# Altium project Electrode_Board.PrjPcb
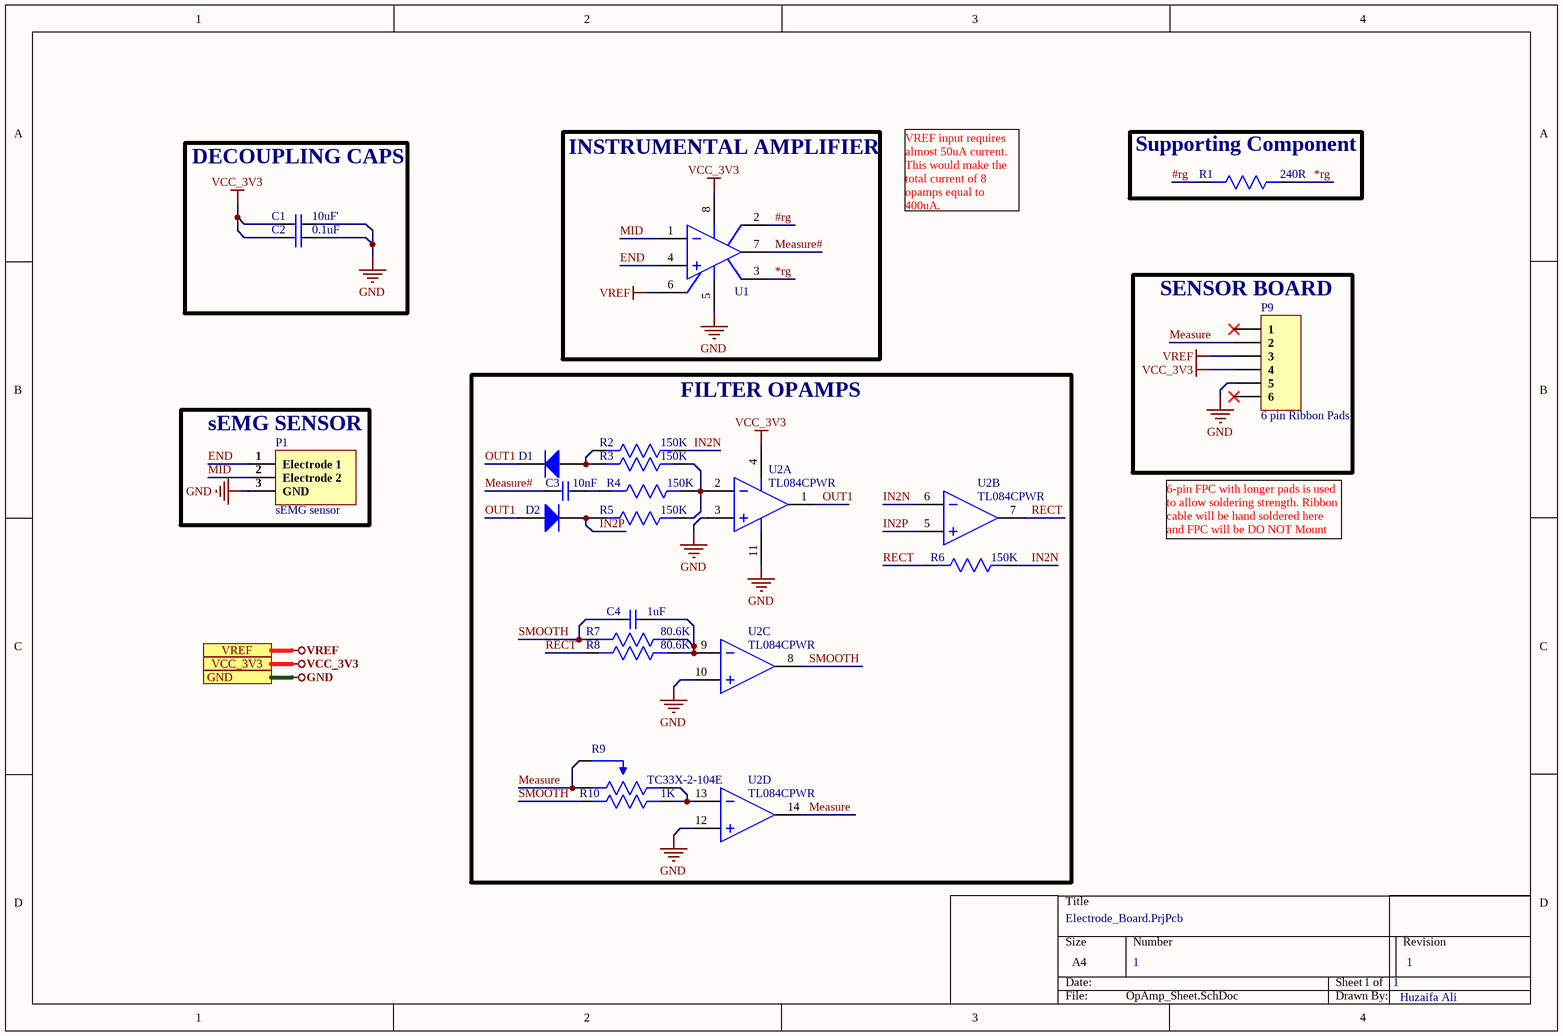
[diagram p0: OpAmp_Sheet.SchDoc]
1 sheet, 20 parts. Net scope: flat (ports and power ports of the same name join across sheets).
Board file: Electrode_PCB.PcbDoc

## Sheet OpAmp_Sheet.SchDoc: =Projectname
size A4; SheetNumber: 1; SheetTotal: 1

### Parts
C1  10uF'  [Cap0603]
C2  0.1uF  [Cap 0402]
C3  10nF  [Cap 0402]
C4  1uF  [Cap 0402]
D1  1N4148WS  [SOD-323]  (value not drawn)
D2  1N4148WS  [SOD-323]  (value not drawn)
P1  sEMG sensor  [sEMG sensor]
P9  6 pin Ribbon Pads  [6 pin Ribbon Pads.]
R1  240R  [Res0402]
R2  150K  [Res0402]
R3  150K  [Res0402]
R4  150K  [Res0402]
R5  150K  [Res0402]
R6  150K  [Res0402]
R7  80.6K  [Res0402]
R8  80.6K  [Res0402]
R9  TC33X-2-104E  [TC33X-2-104E]
R10  1K  [Res0402]
U1  AD8221ARZ-R7  [SOIC-8]  (value not drawn)
U2  TL084CPWR  [14TSSOP]  (parts A,B,C,D of 4)

### Blocks framed on the sheet
INSTRUMENTAL AMPLIFIER: U1
Supporting Component: R1
DECOUPLING CAPS: C1 C2
SENSOR BOARD: P9
sEMG SENSOR: P1
FILTER OPAMPS: C3 C4 D1 D2 R2-R10 U2

### Ports
GND, VCC_3V3, VREF

### Nets
GND: C1.2 C2.2 P1.3(GND) P9.5 U1.5(V-) U2.3(IN+) U2.10(3IN+) U2.11(VCC-) U2.12(4IN+) ; port GND
VCC_3V3: C1.1 C2.1 P9.4 U1.8(V+) U2.4(VCC+) ; port VCC_3V3
VREF: P9.3 U1.6(REF) ; port VREF
#rg: R1.2 U1.2(RG)
*rg: R1.1 U1.3(RG)
END: P1.1(Electrode_1) U1.4(IN+)
IN2N: R2.1 R6.1 U2.6(2IN-)
IN2P: D2.1(K) R5.2 U2.5(2IN+)
Measure: P9.2 R9.1(CCW) R9.2(Wiper) U2.14(4OUT)
Measure#: C3.1 U1.7(VOUT)
MID: P1.2(Electrode_2) U1.1(IN-)
OUT1: D1.1(K) D2.2(A) U2.1(1OUT)
RECT: R6.2 R8.2 U2.7(2OUT)
SMOOTH: C4.1 R7.2 R10.2 U2.8(3OUT)
NetC3_2: C3.2 R4.2
NetC4_2: C4.2 R7.1 R8.1 U2.9(3IN-)
NetD1_2: D1.2(A) R2.2 R3.2
NetR3_1: R3.1 R4.1 R5.1 U2.2(IN-)
NetR9_3: R9.3(CW) R10.1 U2.13(4IN-)

Not connected (* = marked no-connect by the designer): P9 1* 6*

### Notes on the sheet
- VREF input requires almost 50uA current. This would make the total current of 8 opamps equal to 400uA.
- 6-pin FPC with longer pads is used to allow soldering strength. Ribbon cable will be hand soldered here and FPC will be DO NOT Mount
- 1
- Huzaifa Ali

### Library data of the parts
C1 = CL10A106MA8NRNC: CAP CER 10UF 25V X5R 0603; Manufacturer: Samsung; Tolerance: 20%; Supplier 1: Avnet; Manufacturer Part Number: CL10A106MA8NRNC; RoHS: Yes; Category: Ceramic Capacitors; Pricing 1: 4000=0.03753, 8000=0.03700, 16000=0.03595, 24000=0.03515, 32000=0.03383, 40000=0.03304, 400000=0.03225 (USD); Mount: Surface Mount; Case/Package: 0603; Case Code (Metric): 1608; Case Code (Imperial): 0603; Contact Plating: Tin; Min Operating Temperature: -55°C; Max Operating Temperature: 85°C; Package Quantity: 1; Packaging: Tape and Reel; Capacitance: 10uF; Voltage Rating: 25V; Dielectric: X5R; Termination: Wraparound; Series: CL; Construction: Flat; Length: 0.063inch; Width: 0.031inch; Thickness: 0.035inch; Lead Free: Lead Free; RoHS Compliant: Yes; ComponentLink1URL: https://datasheet.ciiva.com/25766/cl10a106ma8nrnc-25766562.pdf?src-supplier=Digi-Key; ComponentLink1Description: https://datasheet.ciiva.com/25766/cl10a106ma8nrnc-25766562.pdf?src-supplier=Digi-Key; Supplier Part Number 1: CL10A106MA8NRNC
C2 = GRM155R71H104ME14D: CAP CER 0.1UF 50V X7R 0402; Manufacturer: Murata; Tolerance: 20%; Capacitance: 100nF; Supplier 1: Digi-Key; Manufacturer Part Number: GRM155R71H104ME14D; Stock 1: 439844; Pricing 1: 1=0.1, 10=0.038, 100=0.0168, 500=0.01198, 1000=0.00941, 2500=0.00855, 5000=0.00787 (USD); Mount: Surface Mount; Case/Package: 0402; Min Operating Temperature: -55°C; Max Operating Temperature: 125°C; Packaging: Cut Tape; Voltage Rating: 50V; Length: 0.039inch; Width: 0.02inch; Thickness: 0.022inch; ComponentLink1URL: http://search.murata.co.jp/Ceramy/image/img/A01X/G101/ENG/GRM155R71H104ME14-01.pdf?src-supplier=Digi-Key; ComponentLink1Description: http://search.murata.co.jp/Ceramy/image/img/A01X/G101/ENG/GRM155R71H104ME14-01.pdf?src-supplier=Digi-Key; ComponentLink2URL: http://psearch.en.murata.com/capacitor/product/GRM155R71H104ME14%23.pdf?src-supplier=Avnet; ComponentLink2Description: http://psearch.en.murata.com/capacitor/product/GRM155R71H104ME14%23.pdf?src-supplier=Avnet; ComponentLink3URL: http://components.arrow.com/part/dataview/0323_07177683?src-supplier=Arrow+Europe; ComponentLink3Description: http://components.arrow.com/part/dataview/0323_07177683?src-supplier=Arrow+Europe; ComponentLink4URL: http://www.mouser.com/ds/2/281/c02e-2905.pdf?src-supplier=Mouser; ComponentLink4Description: http://www.mouser.com/ds/2/281/c02e-2905.pdf?src-supplier=Mouser; Supplier Part Number 1: 490-10701-1-ND
C3 = CC0402KRX7R9BB103: CAP CER 10nF 50V 0402 SMD; Supplier 1: Arrow Electronics; Supplier Part Number 1: CC0402KRX7R9BB103
C4 = CC0402KRX5R7BB105: CAP CER 1UF 16V X5R 0402; Manufacturer: Yageo; Tolerance: 10%; Supplier 1: Digi-Key; Manufacturer Part Number: CC0402KRX5R7BB105; Stock 1: 1405667; Pricing 1: 1=0.36, 10=0.252, 100=0.1512, 500=0.1134, 1000=0.09576, 2500=0.09072, 5000=0.08568 (USD); Mount: Surface Mount; Case/Package: 0402; Weight: 2.3E-05oz; Case Code (Imperial): 0402; Case Code (Metric): 1005; Min Operating Temperature: -55°C; Max Operating Temperature: 85°C; Capacitance: 1uF; Dielectric: X5R; Packaging: Tape and Reel; Voltage Rating (DC): 16V; Voltage Rating: 16V; Termination: SMD/SMT; Composition: Ceramic; Length: 1mm; Height: 0.5mm; Width: 0.02inch; Thickness: 0.022inch; Depth: 0.5mm; Radiation Hardening: No; Lead Free: Lead Free; Halogen Free: Halogen Free; ComponentLink1URL: http://www.yageo.com/documents/recent/UPY-GPHC_X5R_4V-to-50V_12.pdf?src-supplier=Avnet+Europe; ComponentLink1Description: http://www.yageo.com/documents/recent/UPY-GPHC_X5R_4V-to-50V_12.pdf?src-supplier=Avnet+Europe; Supplier Part Number 1: 311-1691-6-ND
D1 D2 = 1N4148WS: 100V -55℃~+150℃@(Tj) 400mW Single 1.25V@150mA 4ns 1μA@75V 200mA SOD-323 Switching Diode ROHS; Manufacturer: YFW; ComponentLink1Description: LCSC; ComponentLink1URL: https://lcsc.com/product-detail/Switching-Diode_YFW-1N4148WS_C1884546.html; Manufacturer Part Number: 1N4148WS
P1 = sEMG sensor: Sensor Connecting Pads
P9 = 6 pin Ribbon Pads: Ribbon wire Connection Pads
R1 = RC0402FR-07240RL: RES SMD 0402 240 Ohm 1% 1/16W ±100ppm/°C Molded SMD Paper T/R; Manufacturer: Yageo; Power Rating: 63mW; Voltage Rating (DC): 50V; Supplier 1: Arrow Electronics; Manufacturer Part Number: RC0402FR-07240RL; RoHS: Yes; Category: Chip SMD Resistors; Stock 1: 3138480; Pricing 1: 10000=0.00190 (USD); Case/Package: 0402; Case Code (Metric): 1005; Case Code (Imperial): 0402; Size Code: 0402; Min Operating Temperature: -55°C; Max Operating Temperature: 155°C; Resistance: 240R; Tolerance: 1%; Packaging: Tape and Reel; Resistor Type: Thick Film; Temperature Coefficient: 100ppm/°C; Voltage Rating: 50V; Package Quantity: 1; Number of Terminations: 2; Termination: SMD/SMT; Max Power Dissipation: 63mW; Features: Moisture Resistant; Series: RC; Construction: Rectangular; Resistance Tolerance: 1%; Length: 1mm; Width: 0.02inch; Height: 0.016inch; Depth: 0.5mm; REACH SVHC: Unknown; Lead Free: Lead Free; RoHS Compliant: Yes; Military Standard: Not; ComponentLink1URL: https://datasheet.ciiva.com/7849/1018594-7849915.pdf?src-supplier=Element14; ComponentLink1Description: https://datasheet.ciiva.com/7849/1018594-7849915.pdf?src-supplier=Element14; ComponentLink2URL: https://datasheet.ciiva.com/7849/1018594-7849916.pdf?src-supplier=Element14; ComponentLink2Description: https://datasheet.ciiva.com/7849/1018594-7849916.pdf?src-supplier=Element14; ComponentLink3URL: https://datasheet.ciiva.com/2519/pyu-r-int-thick-7-2519157.pdf?src-supplier=Digi-Key; ComponentLink3Description: https://datasheet.ciiva.com/2519/pyu-r-int-thick-7-2519157.pdf?src-supplier=Digi-Key; ComponentLink4URL: https://datasheet.ciiva.com/2519/pyu-r-int-thick-7-2519158.pdf?src-supplier=Digi-Key; ComponentLink4Description: https://datasheet.ciiva.com/2519/pyu-r-int-thick-7-2519158.pdf?src-supplier=Digi-Key; ComponentLink5URL: https://datasheet.ciiva.com/2519/pyu-r-int-thick-7-2519156.pdf?src-supplier=Digi-Key; ComponentLink5Description: https://datasheet.ciiva.com/2519/pyu-r-int-thick-7-2519156.pdf?src-supplier=Digi-Key; ComponentLink6URL: https://datasheet.ciiva.com/12669/pyu-rc0402-51-rohs-l-6-r-12669689.pdf?src-supplier=Mouser; ComponentLink6Description: https://datasheet.ciiva.com/12669/pyu-rc0402-51-rohs-l-6-r-12669689.pdf?src-supplier=Mouser; ComponentLink7URL: https://datasheet.ciiva.com/17419/pyu-rc0402-51-rohs-l-6-r-17419482.pdf?src-supplier=Future+Electronics; ComponentLink7Description: https://datasheet.ciiva.com/17419/pyu-rc0402-51-rohs-l-6-r-17419482.pdf?src-supplier=Future+Electronics; Supplier Part Number 1: RC0402FR-07240RL
R2-R6 = RC0402JR-07150KL: RES SMD 0402 150kOhm 5% Paper T/R; Manufacturer: Yageo; Resistance: 150kR; Power Rating: 63mW; Voltage Rating: 50V; Temperature Coefficient: 100ppm/°C; Supplier 1: Arrow Electronics; Manufacturer Part Number: RC0402JR-07150KL; RoHS: Yes; Category: Chip SMD Resistors; Stock 1: 170000; Pricing 1: 10000=0.00100 (USD); Case/Package: 0402; Case Code (Metric): 1005; Case Code (Imperial): 0402; Weight: 2.3E-05oz; Size Code: 0402; Min Operating Temperature: -55°C; Max Operating Temperature: 155°C; Package Quantity: 1; Tolerance: 5%; Packaging: Tape and Reel; Resistor Type: Thick Film; Number of Terminations: 2; Termination: SMD/SMT; Max Power Dissipation: 63mW; Features: Moisture Resistant; Series: RC; Construction: Rectangular; Resistance Tolerance: 5%; Length: 1mm; Width: 0.02inch; Height: 0.016inch; Depth: 0.5mm; REACH SVHC: No SVHC; Military Standard: Not; Lead Free: Lead Free; RoHS Compliant: Yes; ComponentLink1URL: https://datasheet.ciiva.com/7983/1018594-7983551.pdf?src-supplier=Element14; ComponentLink1Description: https://datasheet.ciiva.com/7983/1018594-7983551.pdf?src-supplier=Element14; ComponentLink2URL: https://datasheet.ciiva.com/2518/pyu-r-int-thick-7-2518929.pdf?src-supplier=Digi-Key; ComponentLink2Description: https://datasheet.ciiva.com/2518/pyu-r-int-thick-7-2518929.pdf?src-supplier=Digi-Key; ComponentLink3URL: https://datasheet.ciiva.com/2518/pyu-r-int-thick-7-2518930.pdf?src-supplier=Digi-Key; ComponentLink3Description: https://datasheet.ciiva.com/2518/pyu-r-int-thick-7-2518930.pdf?src-supplier=Digi-Key; ComponentLink4URL: https://datasheet.ciiva.com/2518/pyu-r-int-thick-7-2518928.pdf?src-supplier=Digi-Key; ComponentLink4Description: https://datasheet.ciiva.com/2518/pyu-r-int-thick-7-2518928.pdf?src-supplier=Digi-Key; ComponentLink5URL: https://datasheet.ciiva.com/7850/1018594-7850149.pdf?src-supplier=Element14; ComponentLink5Description: https://datasheet.ciiva.com/7850/1018594-7850149.pdf?src-supplier=Element14; ComponentLink6URL: https://datasheet.ciiva.com/17072/pyu-rc0402-51-rohs-l-6-r-17072379.pdf?src-supplier=Future+Electronics; ComponentLink6Description: https://datasheet.ciiva.com/17072/pyu-rc0402-51-rohs-l-6-r-17072379.pdf?src-supplier=Future+Electronics; ComponentLink7URL: https://datasheet.ciiva.com/15189/getdatasheetpartid-251830-15189543.pdf?src-supplier=Verical; ComponentLink7Description: https://datasheet.ciiva.com/15189/getdatasheetpartid-251830-15189543.pdf?src-supplier=Verical; Supplier Part Number 1: RC0402JR-07150KL
R7 R8 = RC-02W8062FT: 1/16W 50V ±1% ±200ppm/℃ -55℃~+155℃ 80.6kΩ 0402 Chip Resistor - Surface Mount ROHS; Manufacturer: FH; Manufacture Part Number: RC-02W8062FT; Footprint: 0402; Value: 80.6K
R9 = TC33X-2-104E: TRIMMER 100K OHM 0.1W J LEAD TOP; Manufacturer: Bourns; Resistance: 100kR; Tolerance: 25%; Power Rating: 100mW; Number of Turns: 1; Temperature Coefficient: 250ppm/°C; Voltage Rating (DC): 50V; Supplier 1: Arrow Electronics; Manufacturer Part Number: TC33X-2-104E; RoHS: Yes; Category: Variable Resistors and Potentiometers; Stock 1: 12500; Pricing 1: 2500=0.15500, 5000=0.13130 (USD); Mount: Surface Mount; Color: Silver; Weight: 29.4mg; Min Operating Temperature: -40°C; Max Operating Temperature: 100°C; Packaging: Tape and Reel; Package Quantity: 2500; Resistor Type: Carbon,Cermet; Termination: Foot Print; Max Power Dissipation: 100mW; Series: TC33; Resistance Tolerance: 25%; Length: 3mm; Width: 0.118inch; Height: 0.047inch; Depth: 3.8mm; Radiation Hardening: No; REACH SVHC: No SVHC; Military Standard: Not; RoHS Compliant: Yes; ComponentLink1URL: https://datasheet.ciiva.com/11832/0900766b802749b3-11832506.pdf?src-supplier=RSComponents; ComponentLink1Description: https://datasheet.ciiva.com/11832/0900766b802749b3-11832506.pdf?src-supplier=RSComponents; ComponentLink2URL: https://datasheet.ciiva.com/8700/tc33-8700395.pdf?src-supplier=Avnet; ComponentLink2Description: https://datasheet.ciiva.com/8700/tc33-8700395.pdf?src-supplier=Avnet; ComponentLink3URL: https://datasheet.ciiva.com/2155/tc33-2155965.pdf?src-supplier=Digi-Key; ComponentLink3Description: https://datasheet.ciiva.com/2155/tc33-2155965.pdf?src-supplier=Digi-Key; ComponentLink4URL: https://datasheet.ciiva.com/7953/1818686-7953181.pdf?src-supplier=Element14; ComponentLink4Description: https://datasheet.ciiva.com/7953/1818686-7953181.pdf?src-supplier=Element14; ComponentLink5URL: https://datasheet.ciiva.com/16716/70155234-16716301.pdf?src-supplier=Allied+Electronics; ComponentLink5Description: https://datasheet.ciiva.com/16716/70155234-16716301.pdf?src-supplier=Allied+Electronics; ComponentLink6URL: https://datasheet.ciiva.com/2155/tc33-2155966.pdf?src-supplier=Digi-Key; ComponentLink6Description: https://datasheet.ciiva.com/2155/tc33-2155966.pdf?src-supplier=Digi-Key; ComponentLink7URL: https://datasheet.ciiva.com/7953/1818686-7953182.pdf?src-supplier=Element14; ComponentLink7Description: https://datasheet.ciiva.com/7953/1818686-7953182.pdf?src-supplier=Element14; ComponentLink8URL: https://datasheet.ciiva.com/2155/tc33-2155967.pdf?src-supplier=Digi-Key; ComponentLink8Description: https://datasheet.ciiva.com/2155/tc33-2155967.pdf?src-supplier=Digi-Key; Supplier Part Number 1: TC33X-2-104E
R10 = RC0402JR-071KL: RES 1K OHM 5% 1/16W 0402; Manufacturer: Yageo; Resistance: 1kR; Power Rating: 62.5mW; Voltage Rating: 50V; Temperature Coefficient: 100ppm/°C; Max Power Dissipation: 63mW; Supplier 1: Digi-Key; Manufacturer Part Number: RC0402JR-071KL; RoHS: Yes; Category: Chip SMD Resistors; Stock 1: 452315; Pricing 1: 1=0.10000, 10=0.01300, 100=0.00540, 1000=0.00244, 2500=0.00212, 5000=0.00175 (USD); Case/Package: 0402; Case Code (Imperial): 0402; Case Code (Metric): 1005; Size Code: 0402; Min Operating Temperature: -55°C; Max Operating Temperature: 155°C; Tolerance: 5%; Packaging: Tape and Reel; Package Quantity: 1; Termination: SMD/SMT; Resistor Type: Thick Film; Number of Terminations: 2; Features: Moisture Resistant; Series: RC; Resistance Tolerance: 5%; Construction: Rectangular; Length: 0.039inch; Width: 0.02inch; Height: 0.016inch; Depth: 0.5mm; REACH SVHC: No SVHC; Military Standard: Not; Lead Free: Lead Free; RoHS Compliant: Yes; ComponentLink1URL: https://datasheet.ciiva.com/7983/1018594-7983558.pdf?src-supplier=Element14; ComponentLink1Description: https://datasheet.ciiva.com/7983/1018594-7983558.pdf?src-supplier=Element14; ComponentLink2URL: https://datasheet.ciiva.com/2452/pyu-r-int-thick-7-2452756.pdf?src-supplier=Digi-Key; ComponentLink2Description: https://datasheet.ciiva.com/2452/pyu-r-int-thick-7-2452756.pdf?src-supplier=Digi-Key; ComponentLink3URL: https://datasheet.ciiva.com/2452/pyu-r-int-thick-7-2452757.pdf?src-supplier=Digi-Key; ComponentLink3Description: https://datasheet.ciiva.com/2452/pyu-r-int-thick-7-2452757.pdf?src-supplier=Digi-Key; ComponentLink4URL: https://datasheet.ciiva.com/2452/pyu-r-int-thick-7-2452755.pdf?src-supplier=Digi-Key; ComponentLink4Description: https://datasheet.ciiva.com/2452/pyu-r-int-thick-7-2452755.pdf?src-supplier=Digi-Key; ComponentLink5URL: https://datasheet.ciiva.com/7850/1018594-7850170.pdf?src-supplier=Element14; ComponentLink5Description: https://datasheet.ciiva.com/7850/1018594-7850170.pdf?src-supplier=Element14; ComponentLink6URL: https://datasheet.ciiva.com/7850/1018594-7850171.pdf?src-supplier=Element14; ComponentLink6Description: https://datasheet.ciiva.com/7850/1018594-7850171.pdf?src-supplier=Element14; ComponentLink7URL: https://datasheet.ciiva.com/17081/pyu-rc0402-51-rohs-l-6-r-17081438.pdf?src-supplier=Future+Electronics; ComponentLink7Description: https://datasheet.ciiva.com/17081/pyu-rc0402-51-rohs-l-6-r-17081438.pdf?src-supplier=Future+Electronics; Supplier Part Number 1: 311-1.0KJRCT-ND
U1 = AD8221ARZ-R7: IC OPAMP INSTR 825KHZ 8SOIC; Manufacturer: Analog Devices; Number of Channels: 1; Common Mode Rejection Ratio: 80dB; Min Dual Supply Voltage: 2.3V; Max Dual Supply Voltage: 18V; Slew Rate: 2.5V/µs; Nominal Supply Current: 1mA; Max Power Dissipation: 200mW; Bandwidth: 562kHz; Input Bias Current: 1.5nA; Input Offset Voltage (Vos): 60uV; Output Current per Channel: 18mA; Power Supply Rejection Ratio (PSRR): 130dB; Voltage Gain: 60dB; Input Resistance: 100GR; Quiescent Current: 900uA; Operating Supply Voltage: 36V; Supplier 1: Mouser; Manufacturer Part Number: AD8221ARZ-R7; RoHS: Yes; Category: Amplifiers - Op Amps, Buffer, Instrumentation; Pricing 1: 1=7.37000, 10=6.66000, 25=6.35000, 50=6.35000, 100=5.51000, 250=5.27000, 500=4.80000, 1000=4.37000, 10000=4.37000 (USD); Case/Package: SOIC; Number of Pins: 8; Contact Plating: Tin,Matte; Min Operating Temperature: -40°C; Max Operating Temperature: 85°C; -3db Bandwidth: 825kHz; Package Quantity: 1000; Packaging: Tape and Reel; Number of Circuits: 1; Operating Supply Current: 1mA; Number of Elements: 1; Power Dissipation: 200mW; Series: -; Supply Current: 1mA; Radiation Hardening: No; Lead Free: Contains Lead; RoHS Compliant: Yes; ComponentLink1URL: https://datasheet.ciiva.com/15128/getdatasheetpartid-313520-15128733.pdf?src-supplier=Verical; ComponentLink1Description: https://datasheet.ciiva.com/15128/getdatasheetpartid-313520-15128733.pdf?src-supplier=Verical; ComponentLink2URL: https://datasheet.ciiva.com/2975/ad8221-2975658.pdf?src-supplier=Avnet; ComponentLink2Description: https://datasheet.ciiva.com/2975/ad8221-2975658.pdf?src-supplier=Avnet; ComponentLink3URL: https://datasheet.ciiva.com/2975/ad8221-2975980.pdf?src-supplier=Avnet; ComponentLink3Description: https://datasheet.ciiva.com/2975/ad8221-2975980.pdf?src-supplier=Avnet; ComponentLink4URL: https://datasheet.ciiva.com/6628/ad8221-6628618.pdf?src-supplier=Digi-Key; ComponentLink4Description: https://datasheet.ciiva.com/6628/ad8221-6628618.pdf?src-supplier=Digi-Key; ComponentLink5URL: https://datasheet.ciiva.com/6628/ad8221-6628619.pdf?src-supplier=Digi-Key; ComponentLink5Description: https://datasheet.ciiva.com/6628/ad8221-6628619.pdf?src-supplier=Digi-Key; ComponentLink6URL: https://datasheet.ciiva.com/6628/ad8221-6628617.pdf?src-supplier=Digi-Key; ComponentLink6Description: https://datasheet.ciiva.com/6628/ad8221-6628617.pdf?src-supplier=Digi-Key; ComponentLink7URL: https://datasheet.ciiva.com/48709/001249009-da-01-en-ic-amp-inst-prec-ad8221arz-r7-soic-8-adi-48709526.pdf?src-supplier=Conrad; ComponentLink7Description: https://datasheet.ciiva.com/48709/001249009-da-01-en-ic-amp-inst-prec-ad8221arz-r7-soic-8-adi-48709526.pdf?src-supplier=Conrad; Supplier Part Number 1: 584-AD8221ARZ-R7
U2 = TL084CPWR: IC OPAMP JFET 4 CIRCUIT 14TSSOP; Manufacturer: Texas Instruments; Nominal Supply Current: 11.2mA; Number of Channels: 4; Voltage Gain: 106.02dB; Max Dual Supply Voltage: 18V; Min Dual Supply Voltage: 3.5V; Unity Gain Bandwidth Product: 3MHz; Common Mode Rejection Ratio: 70dB; Slew Rate: 13V/µs; Max I/O Voltage: 15mV; Input Bias Current: 400pA; Operating Supply Current: 1.4mA; Min Supply Voltage: 7V; Quiescent Current: 2.8A; Max Power Dissipation: 680mW; Supplier 1: Mouser; Manufacturer Part Number: TL084CPWR; RoHS: Yes; Category: Amplifiers - Op Amps, Buffer, Instrumentation; Stock 1: 3; Pricing 1: 1=0.64000, 10=0.54500, 50=0.54500, 100=0.37800, 500=0.32000, 1000=0.24700, 2000=0.22500, 10000=0.22500 (USD); Case/Package: TSSOP; Number of Pins: 14; Contact Plating: Gold; Min Operating Temperature: -40°C; Max Operating Temperature: 125°C; Packaging: Tape and Reel; Package Quantity: 1; Bandwidth: 3MHz; Nominal Gain Bandwidth Product: 3MHz; Number of Circuits: 4; Gain Bandwidth Product: 3MHz; Input Offset Voltage (Vos): 15mV; Number of Elements: 4; Max Supply Voltage: 18V; Number of Amplifiers: 4; Radiation Hardening: No; Lead Free: Lead Free; RoHS Compliant: Yes; REACH SVHC: No SVHC; ComponentLink1URL: https://datasheet.ciiva.com/34301/1064719-34301936.pdf?src-supplier=Jameco; ComponentLink1Description: https://datasheet.ciiva.com/34301/1064719-34301936.pdf?src-supplier=Jameco; ComponentLink2URL: https://datasheet.ciiva.com/1795/tl081a-1795644.pdf?src-supplier=Digi-Key; ComponentLink2Description: https://datasheet.ciiva.com/1795/tl081a-1795644.pdf?src-supplier=Digi-Key; ComponentLink3URL: https://datasheet.ciiva.com/1795/tl081a-1795643.pdf?src-supplier=Digi-Key; ComponentLink3Description: https://datasheet.ciiva.com/1795/tl081a-1795643.pdf?src-supplier=Digi-Key; ComponentLink4URL: https://datasheet.ciiva.com/1795/tl081a-1795645.pdf?src-supplier=Digi-Key; ComponentLink4Description: https://datasheet.ciiva.com/1795/tl081a-1795645.pdf?src-supplier=Digi-Key; ComponentLink5URL: https://datasheet.ciiva.com/14459/tl082-14459749.pdf?src-supplier=Avnet; ComponentLink5Description: https://datasheet.ciiva.com/14459/tl082-14459749.pdf?src-supplier=Avnet; ComponentLink6URL: https://datasheet.ciiva.com/48707/001072249-da-01-en-ic-opamp-jfet-3mh-tl084cpwr-tssop-14-tid-48707867.pdf?src-supplier=Conrad; ComponentLink6Description: https://datasheet.ciiva.com/48707/001072249-da-01-en-ic-opamp-jfet-3mh-tl084cpwr-tssop-14-tid-48707867.pdf?src-supplier=Conrad; Supplier Part Number 1: 595-TL084CPWR